# EasyEDA Pro project htx-studio-project_kpilekig-42ad306f.epro, board Button
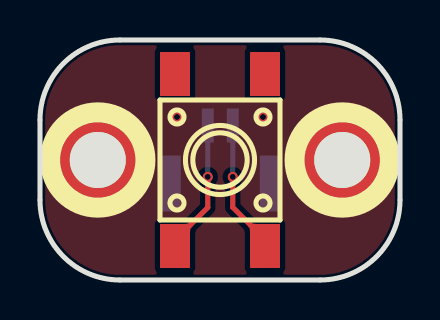
[diagram p4: board, top side]
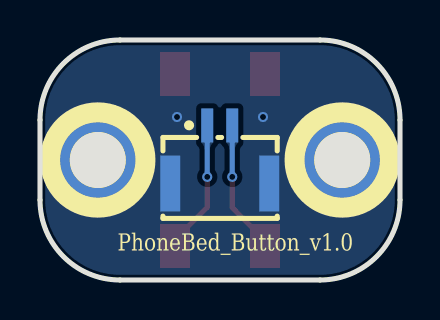
[diagram p5: board, bottom side, seen from below]

Outline 18 x 12 mm; copper layers: Top Layer, Bottom Layer. Coordinates in mm from the lower left corner of the outline.
Outline path: 0,8 0,4 arc(1.17,1.17) 4,0 14,0 arc(16.83,1.17) 18,4 18,8 arc(16.83,10.83) 14,12 4,12 arc(1.17,10.83) 0,8
Stack: Top Layer 0.035mm / Dielectric1 1.51mm FR4 er 4.5 / Bottom Layer 0.035mm

## Design rules (mm)
spacing copperThickness1oz (default): track to track 0.102, other pairs 0.152 to 0.3
spacing copperThickness2oz: track to track 0.203, other pairs 0.152 to 0.3
spacing Plane_innerPlane: track to track 0.102, other pairs 0.152 to 0.3
spacing Copper_copperRegion: track to track 0.102, other pairs 0.152 to 0.3
track width copperThickness1oz (default): min 0.127, default 0.254, max 2.54
track width copperThickness2oz: min 0.203, default 0.254, max 2.54
differential pair differentialPair (default): width min 0.127, default 0.254, max 2.54; gap min 0.152, default 0.152
pour e20 uses Copper_copperRegion
pour e22 uses Copper_copperRegion

## Placement (name value [footprint] x y rotation side)
CN3  WAFER-GH1.25-2PWB  [CONN-TH_2P-P1.25_XUNPU_WAFER-GH1.25-2PWB]  9.01 6.28 180 bottom
NOREF  -  [Pad_e5]  2.89 6 0 top
NOREF#2  -  [Pad_e6]  15.11 6 0 top
U1  ZX-QC66-7.5TP  [KEY-SMD_4P-L6.0-W6.0-P4.50-LS8.6]  9 6 270 top

## Footprints (pads in the part's own frame, mm; a bottom-side part is the same pattern mirrored in y, then rotated)
CONN-TH_2P-P1.25_XUNPU_WAFER-GH1.25-2PWB
  rect 0.6x1.7 smd: 1(-0.625,1.45) 2(0.625,1.45)
  rect 1x2.8 smd: 3(-2.475,-1.45) 4(2.475,-1.45)
KEY-SMD_4P-L6.0-W6.0-P4.50-LS8.6
  rect 2.2x1.5 smd: 1(-4.3,2.25) 2(4.3,2.25) 3(-4.3,-2.25) 4(4.3,-2.25)
Pad_e5
  round 4 hole 2.8: 1(0,0)
Pad_e6
  round 4 hole 2.8: 1(0,0)

## Nets
As in the schematic.

Pads without a net: NOREF 1; NOREF#2 1; U1 1 3

## Via types
v1: diameter 0.5, hole 0.3, Top Layer to Bottom Layer, 4 vias

## Routing (per net, layer and track width the routed paths; a pad name or vN(x,y) marks a point on that pad's centre or on a via; arc(x,y) is an arc through that point)
GND:
  vias: v1(6.85,8.15) v1(11.15,8.15)
$1N231: length 6.9
  Top Layer w0.254: v1(9.64,5.16) 9.64,3.63 11.25,2.02 U1.2
  Bottom Layer w0.254: 9.64,7.95 v1(9.64,5.16)
$1N237: length 6.9
  Top Layer w0.254: v1(8.39,5.16) 8.39,3.62 6.75,1.99 U1.4
  Bottom Layer w0.254: 8.39,7.95 v1(8.39,5.16)

## Copper pours and planes (outline as drawn; the poured copper is in the pictures)
GND on Top Layer: 0,8 0.02,8.35 0.07,8.74 0.16,9.13 0.3,9.51 0.46,9.87 0.67,10.21 0.9,10.53 1.17,10.83 1.47,11.1 1.79,11.33 2.13,11.54 2.49,11.7 2.87,11.84 3.26,11.93 3.65,11.98 4,12 14,12 14.35,11.98 14.74,11.93 15.13,11.84 15.51,11.7 15.87,11.54 16.21,11.33 16.53,11.1 16.83,10.83 17.1,10.53 17.33,10.21 17.54,9.87 17.7,9.51 17.84,9.13 17.93,8.74 17.98,8.35 18,8 18,4 17.98,3.65 17.93,3.26 17.84,2.87 17.7,2.49 17.54,2.13 17.33,1.79 17.1,1.47 16.83,1.17 16.53,0.9 16.21,0.67 15.87,0.46 15.51,0.3 15.13,0.16 14.74,0.07 14.35,0.02 14,0 4,0 3.65,0.02 3.26,0.07 2.87,0.16 2.49,0.3 2.13,0.46 1.79,0.67 1.47,0.9 1.17,1.17 0.9,1.47 0.67,1.79 0.46,2.13 0.3,2.49 0.16,2.87 0.07,3.26 0.02,3.65 0,4
GND on Bottom Layer: 0,8 0.02,8.35 0.07,8.74 0.16,9.13 0.3,9.51 0.46,9.87 0.67,10.21 0.9,10.53 1.17,10.83 1.47,11.1 1.79,11.33 2.13,11.54 2.49,11.7 2.87,11.84 3.26,11.93 3.65,11.98 4,12 14,12 14.35,11.98 14.74,11.93 15.13,11.84 15.51,11.7 15.87,11.54 16.21,11.33 16.53,11.1 16.83,10.83 17.1,10.53 17.33,10.21 17.54,9.87 17.7,9.51 17.84,9.13 17.93,8.74 17.98,8.35 18,8 18,4 17.98,3.65 17.93,3.26 17.84,2.87 17.7,2.49 17.54,2.13 17.33,1.79 17.1,1.47 16.83,1.17 16.53,0.9 16.21,0.67 15.87,0.46 15.51,0.3 15.13,0.16 14.74,0.07 14.35,0.02 14,0 4,0 3.65,0.02 3.26,0.07 2.87,0.16 2.49,0.3 2.13,0.46 1.79,0.67 1.47,0.9 1.17,1.17 0.9,1.47 0.67,1.79 0.46,2.13 0.3,2.49 0.16,2.87 0.07,3.26 0.02,3.65 0,4

Small or netless copper shapes (teardrops, artwork), in the pictures only: 4 on Top Layer, 4 on Bottom Layer

## Text on the board
Bottom Silkscreen Layer: PhoneBed_Button_v1.0
